# Altium schematic sheet Top Sheet.SchDoc
size A; DocumentNumber: 1; SheetNumber: 1; SheetTotal: 7
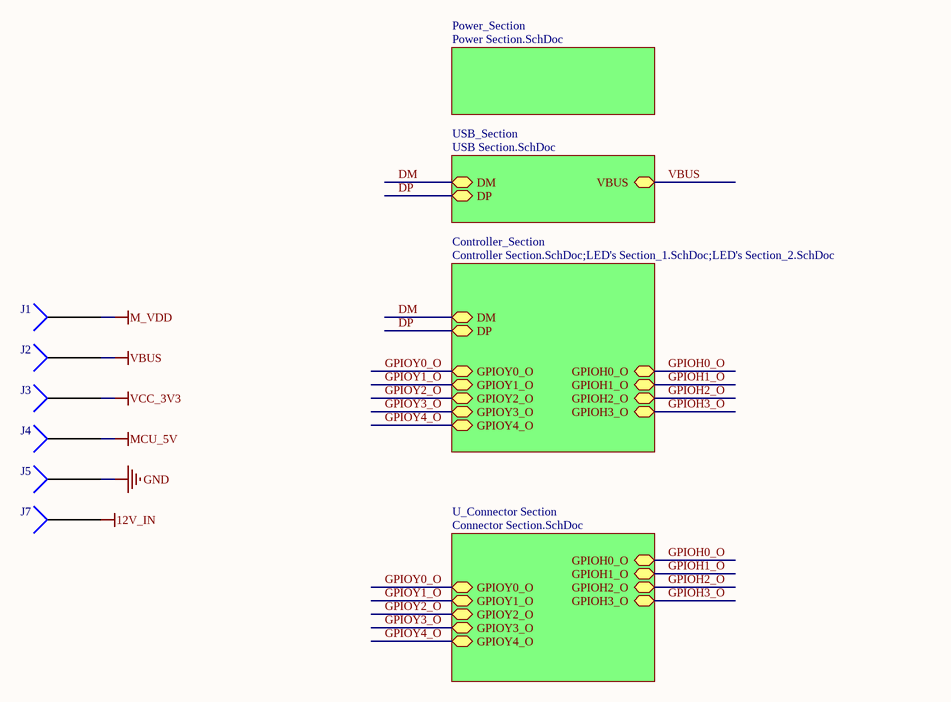
[diagram p0: Top Sheet.SchDoc]

## Parts
J1  Socket  [Socket]  (value not drawn)
J2  Socket  [Socket]  (value not drawn)
J3  Socket  [Socket]  (value not drawn)
J4  Socket  [Socket]  (value not drawn)
J5  Socket  [Socket]  (value not drawn)
J7  Socket  [Socket]  (value not drawn)

## Sub-sheets
Controller_Section = Controller Section.SchDoc;LED's Section_1.SchDoc;LED's Section_2.SchDoc: DP (bidir), GPIOY0_O (bidir), DM (bidir), GPIOY1_O (bidir), GPIOH0_O (bidir), GPIOH1_O (bidir), GPIOY3_O (bidir), GPIOY2_O (bidir), GPIOH2_O (bidir), GPIOH3_O (bidir), GPIOY4_O (bidir)
Power_Section = Power Section.SchDoc: no entries
U_Connector Section = Connector Section.SchDoc: GPIOY0_O (bidir), GPIOH0_O (bidir), GPIOY1_O (bidir), GPIOH1_O (bidir), GPIOY2_O (bidir), GPIOH2_O (bidir), GPIOY3_O (bidir), GPIOH3_O (bidir), GPIOY4_O (bidir)
USB_Section = USB Section.SchDoc: DP (bidir), DM (bidir), VBUS (bidir)

## Nets
12V_IN: J7.1
GND: J5.1
M_VDD: J1.1
MCU_5V: J4.1
VBUS: J2.1 ; sheet USB_Section/VBUS
VCC_3V3: J3.1
DM: sheet Controller_Section/DM, sheet USB_Section/DM
DP: sheet Controller_Section/DP, sheet USB_Section/DP
GPIOH0_O: sheet Controller_Section/GPIOH0_O, sheet U_Connector Section/GPIOH0_O
GPIOH1_O: sheet Controller_Section/GPIOH1_O, sheet U_Connector Section/GPIOH1_O
GPIOH2_O: sheet Controller_Section/GPIOH2_O, sheet U_Connector Section/GPIOH2_O
GPIOH3_O: sheet Controller_Section/GPIOH3_O, sheet U_Connector Section/GPIOH3_O
GPIOY0_O: sheet Controller_Section/GPIOY0_O, sheet U_Connector Section/GPIOY0_O
GPIOY1_O: sheet Controller_Section/GPIOY1_O, sheet U_Connector Section/GPIOY1_O
GPIOY2_O: sheet Controller_Section/GPIOY2_O, sheet U_Connector Section/GPIOY2_O
GPIOY3_O: sheet Controller_Section/GPIOY3_O, sheet U_Connector Section/GPIOY3_O
GPIOY4_O: sheet Controller_Section/GPIOY4_O, sheet U_Connector Section/GPIOY4_O

## Library data of the parts
J1-J5 J7 = Socket: LatestRevisionDate: 17-Jul-2002; LatestRevisionNote: Re-released for DXP Platform.; Publisher: Altium Limited